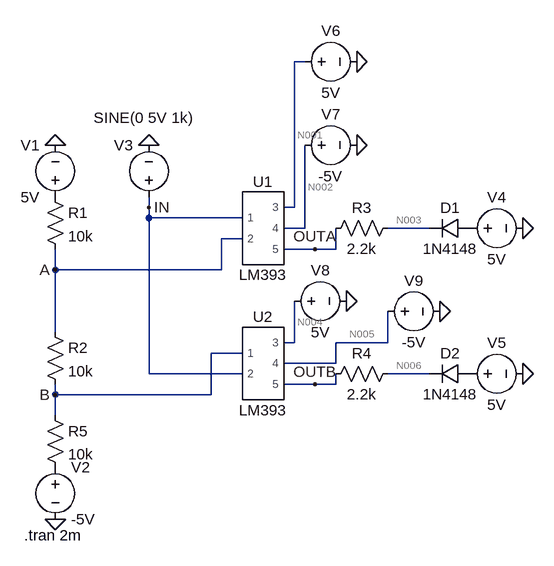
[diagram p0: schematic Example-7-5-a.asc]
Example-7-5-a.asc, the LTspice schematic file:
Version 4.1
SHEET 1 880 680
WIRE 272 -176 256 -176
WIRE 32 48 32 32
WIRE 256 48 256 -176
WIRE 256 48 240 48
WIRE 32 64 32 48
WIRE 176 64 32 64
WIRE 272 80 272 -48
WIRE 272 80 240 80
WIRE 464 80 400 80
WIRE 176 96 144 96
WIRE 288 112 240 112
WIRE 320 112 320 80
WIRE 320 112 288 112
WIRE -112 144 -112 112
WIRE 144 144 144 96
WIRE 144 144 -112 144
WIRE -112 240 -112 144
WIRE 256 256 256 192
WIRE 256 256 240 256
WIRE 400 256 400 208
WIRE 400 256 320 256
WIRE 176 272 128 272
WIRE 320 288 320 256
WIRE 320 288 240 288
WIRE 32 304 32 64
WIRE 176 304 32 304
WIRE 464 304 400 304
WIRE 288 320 240 320
WIRE 320 320 320 304
WIRE 320 320 288 320
WIRE -112 336 -112 320
WIRE 128 336 128 272
WIRE 128 336 -112 336
WIRE -112 368 -112 336
FLAG -112 -48 0
FLAG -112 528 0
FLAG 32 -48 0
FLAG 608 80 0
FLAG 608 304 0
FLAG -112 144 A
FLAG -112 336 B
FLAG 288 112 OUTA
FLAG 288 320 OUTB
FLAG 32 48 IN
FLAG 352 -176 0
FLAG 352 -48 0
FLAG 336 192 0
FLAG 480 208 0
SYMBOL res -128 16 R0
SYMATTR InstName R1
SYMATTR Value 10k
SYMBOL res -128 224 R0
SYMATTR InstName R2
SYMATTR Value 10k
SYMBOL voltage -112 48 R180
WINDOW 0 24 96 Left 2
WINDOW 3 24 16 Left 2
WINDOW 123 0 0 Left 0
WINDOW 39 0 0 Left 0
SYMATTR InstName V1
SYMATTR Value 5V
SYMBOL voltage -112 432 R0
WINDOW 123 0 0 Left 0
WINDOW 39 0 0 Left 0
SYMATTR InstName V2
SYMATTR Value -5V
SYMBOL voltage 32 48 R180
WINDOW 0 24 96 Left 2
WINDOW 3 -69 138 Left 2
WINDOW 123 0 0 Left 0
WINDOW 39 0 0 Left 0
SYMATTR InstName V3
SYMATTR Value SINE(0 5V 1k)
SYMBOL diode 528 64 R90
WINDOW 0 0 32 VBottom 2
WINDOW 3 32 32 VTop 2
SYMATTR InstName D1
SYMATTR Value 1N4148
SYMBOL diode 528 288 R90
WINDOW 0 0 32 VBottom 2
WINDOW 3 32 32 VTop 2
SYMATTR InstName D2
SYMATTR Value 1N4148
SYMBOL res 416 64 R90
WINDOW 0 0 56 VBottom 2
WINDOW 3 32 56 VTop 2
SYMATTR InstName R3
SYMATTR Value 2.2k
SYMBOL res 416 288 R90
WINDOW 0 0 56 VBottom 2
WINDOW 3 32 56 VTop 2
SYMATTR InstName R4
SYMATTR Value 2.2k
SYMBOL voltage 512 80 R270
WINDOW 0 32 56 VTop 2
WINDOW 3 -32 56 VBottom 2
WINDOW 123 0 0 Left 0
WINDOW 39 0 0 Left 0
SYMATTR InstName V4
SYMATTR Value 5V
SYMBOL voltage 512 304 R270
WINDOW 0 32 56 VTop 2
WINDOW 3 -32 56 VBottom 2
WINDOW 123 0 0 Left 0
WINDOW 39 0 0 Left 0
SYMATTR InstName V5
SYMATTR Value 5V
SYMBOL res -128 352 R0
SYMATTR InstName R5
SYMATTR Value 10k
SYMBOL LM393 208 80 R0
SYMATTR InstName U1
SYMBOL LM393 208 288 R0
SYMATTR InstName U2
SYMBOL voltage 256 -176 R270
WINDOW 0 32 56 VTop 2
WINDOW 3 -32 56 VBottom 2
WINDOW 123 0 0 Left 0
WINDOW 39 0 0 Left 0
SYMATTR InstName V6
SYMATTR Value 5V
SYMBOL voltage 256 -48 R270
WINDOW 0 32 56 VTop 2
WINDOW 3 -32 56 VBottom 2
WINDOW 123 0 0 Left 0
WINDOW 39 0 0 Left 0
SYMATTR InstName V7
SYMATTR Value -5V
SYMBOL voltage 240 192 R270
WINDOW 0 32 56 VTop 2
WINDOW 3 -32 56 VBottom 2
WINDOW 123 0 0 Left 0
WINDOW 39 0 0 Left 0
SYMATTR InstName V8
SYMATTR Value 5V
SYMBOL voltage 384 208 R270
WINDOW 0 32 56 VTop 2
WINDOW 3 -32 56 VBottom 2
WINDOW 123 0 0 Left 0
WINDOW 39 0 0 Left 0
SYMATTR InstName V9
SYMATTR Value -5V
TEXT -160 552 Left 2 !.tran 2m

The netlist it stands for:
* Example-7-5-a.asc
R1 P001 A 10k
R2 A B 10k
V1 P001 0 5V
V2 P002 0 -5V
V3 IN 0 SINE(0 5V 1k)
D1 P003 N003 1N4148
D2 P004 N006 1N4148
R3 N003 OUTA 2.2k
R4 N006 OUTB 2.2k
V4 P003 0 5V
V5 P004 0 5V
R5 B P002 10k
X§U1 IN A N001 N002 OUTA LM393  ; pins 1 2 3 4 5
X§U2 B IN N004 N005 OUTB LM393  ; pins 1 2 3 4 5
V6 N001 0 5V
V7 N002 0 -5V
V8 N004 0 5V
V9 N005 0 -5V
.model D D
.lib standard.dio
.tran 2m
.lib LM393.5_1
.backanno
.end

* Results of the author's LTspice run, read from the files saved beside the schematic
* Operating Point, zero values left out:
*   V(a) = 1.667 V
*   V(b) = -1.666 V
*   V(n001) = 5 V
*   V(n002) = -5 V
*   V(n003) = 4.348 V
*   V(n004) = 5 V
*   V(n005) = -5 V
*   V(n006) = 4.348 V
*   V(outa) = -4.902 V
*   V(outb) = -4.902 V
*   V(p001) = 5 V
*   V(p002) = -5 V
*   V(p003) = 5 V
*   V(p004) = 5 V
*   I(D1) = 4.205 mA
*   I(D2) = 4.205 mA
*   I(R1) = 333.3 µA
*   I(R2) = 333.3 µA
*   I(R3) = 4.205 mA
*   I(R4) = 4.205 mA
*   I(R5) = 333.4 µA
*   I(V1) = -333.3 µA
*   I(V2) = 333.4 µA
*   I(V3) = 49.96 nA
*   I(V4) = -4.205 mA
*   I(V5) = -4.205 mA
*   I(V6) = -216 µA
*   I(V7) = 4.421 mA
*   I(V8) = -216 µA
*   I(V9) = 4.421 mA
*   Ix(u1:1) = -49.97 nA
*   Ix(u1:2) = 8.188 pA
*   Ix(u1:3) = 216 µA
*   Ix(u1:4) = -4.421 mA
*   Ix(u1:5) = 4.205 mA
*   Ix(u2:1) = -49.97 nA
*   Ix(u2:2) = 6.527 pA
*   Ix(u2:3) = 216 µA
*   Ix(u2:4) = -4.421 mA
*   Ix(u2:5) = 4.205 mA
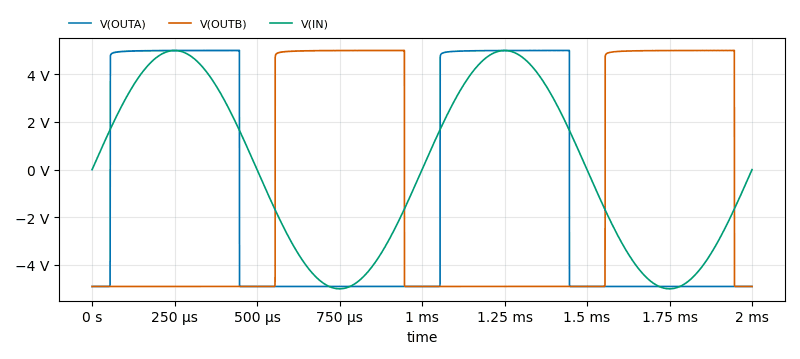
[diagram p1: Transient Analysis of Example-7-5-a.asc, plotted from the saved traces]
* Transient Analysis, 1 run:
*   V(OUTA): min -4.902 V, max 5.005 V, average -1.028 V, rms 4.934 V, last -4.902 V
*   V(OUTB): min -4.902 V, max 5.003 V, average -1.028 V, rms 4.934 V, last -4.902 V
*   V(IN): min -5 V, max 5 V, average 0 V, rms 3.536 V, last 0 V